# Altium schematic sheet PWM-TO-DAC-BOARD.SchDoc
size A4; SheetNumber: 2; SheetTotal: 4
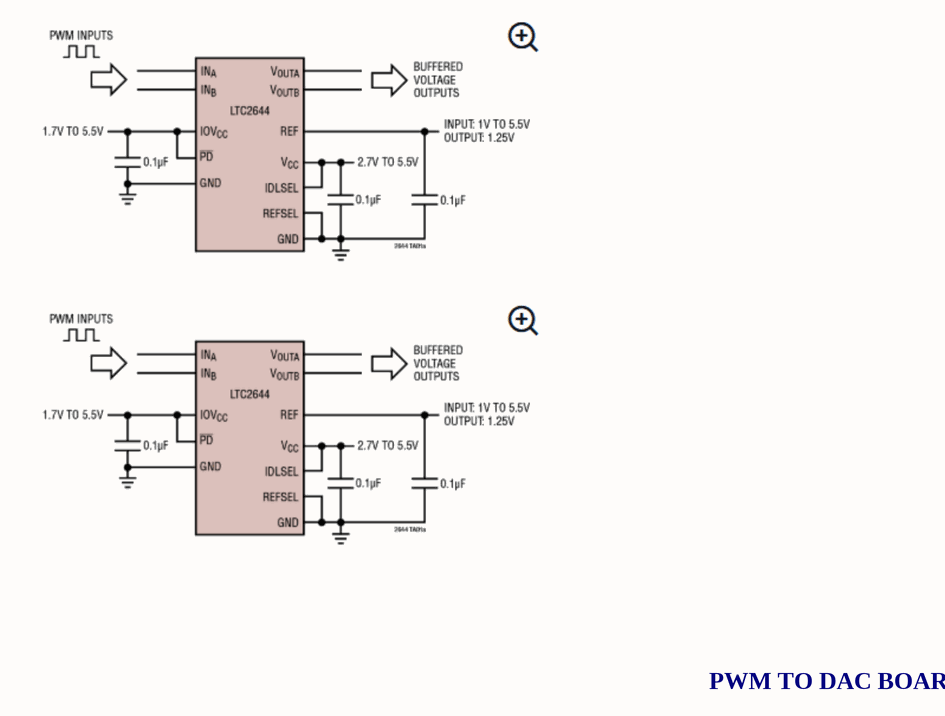
[diagram p0: PWM-TO-DAC-BOARD.SchDoc]

## Notes on the sheet
- PWM TO DAC BOARD